# Altium schematic sheet RevisionHistory.SchDoc
size A3; SheetNumber: 7; SheetTotal: 7
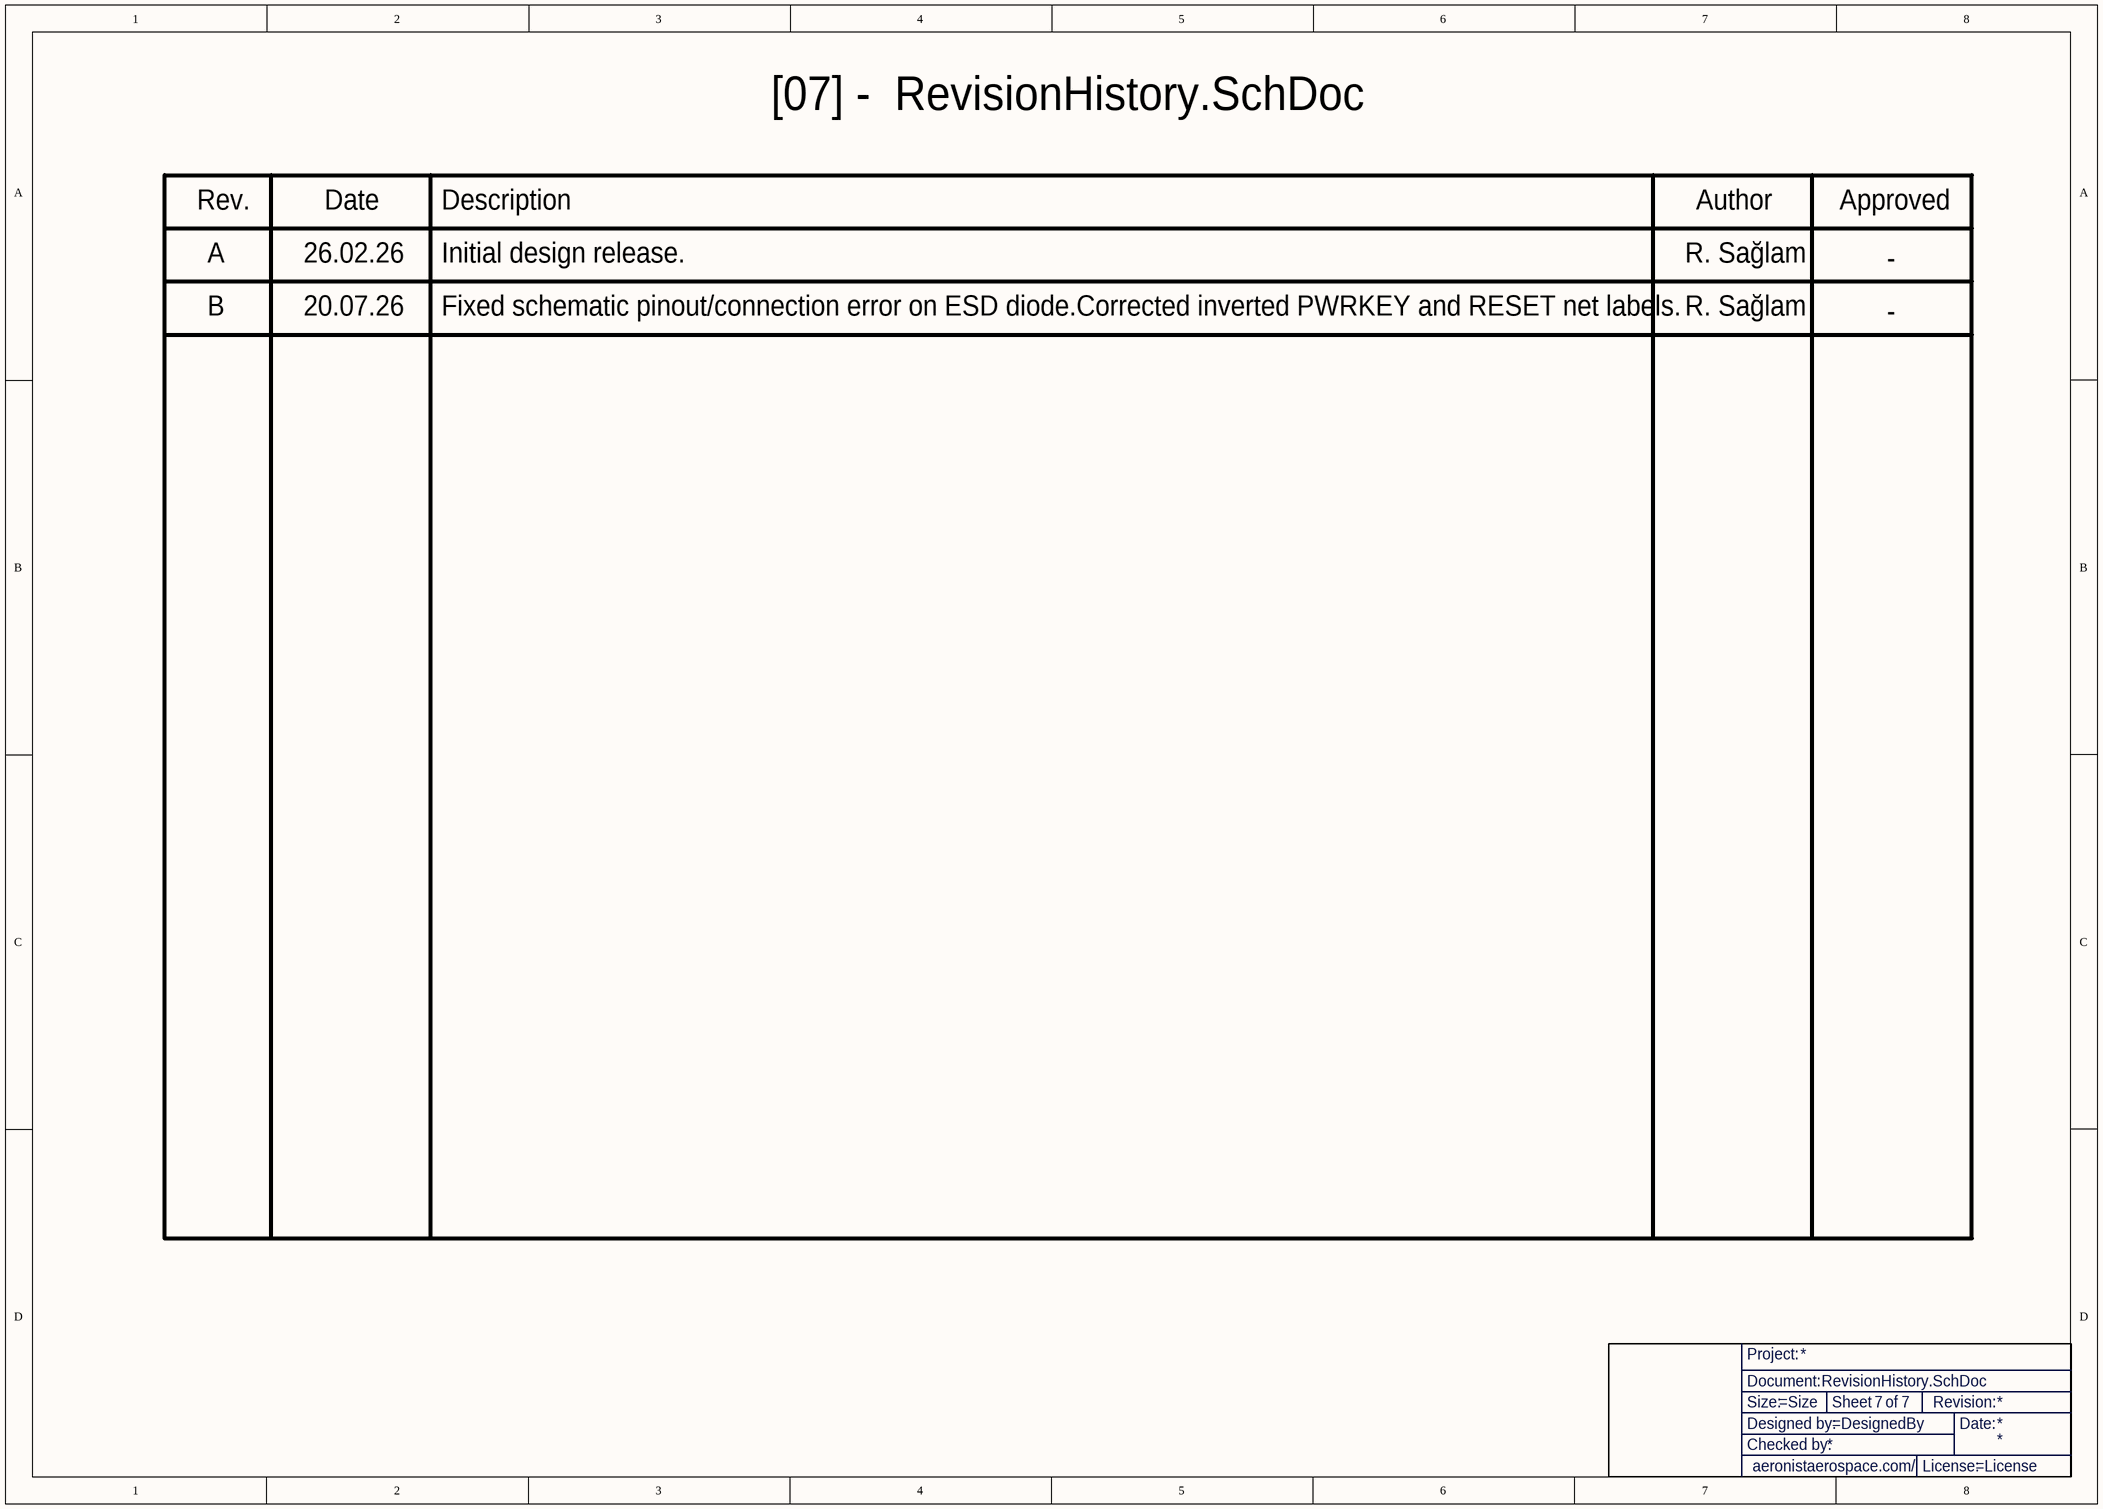
[diagram p0: RevisionHistory.SchDoc]

## Parts
?  Title Block  (value not drawn)  (graphical)

## Notes on the sheet
- [07] -  RevisionHistory.SchDoc
- Rev.
- Date
- Description
- Author
- Approved
- A
- 26.02.26
- Initial design release.
- R. Sağlam
- -
- B
- 20.07.26
- Fixed schematic pinout/connection error on ESD diode.Corrected inverted PWRKEY and RESET net labels.
- (in symbol Title Block) Project:; Document:; Size:; Sheet; of; Revision:; Designed by:; Date:; Checked by:; aeronistaerospace.com/; License: